# Altium project Smart_Connect_Board.PrjPcb (part 1 of 4)
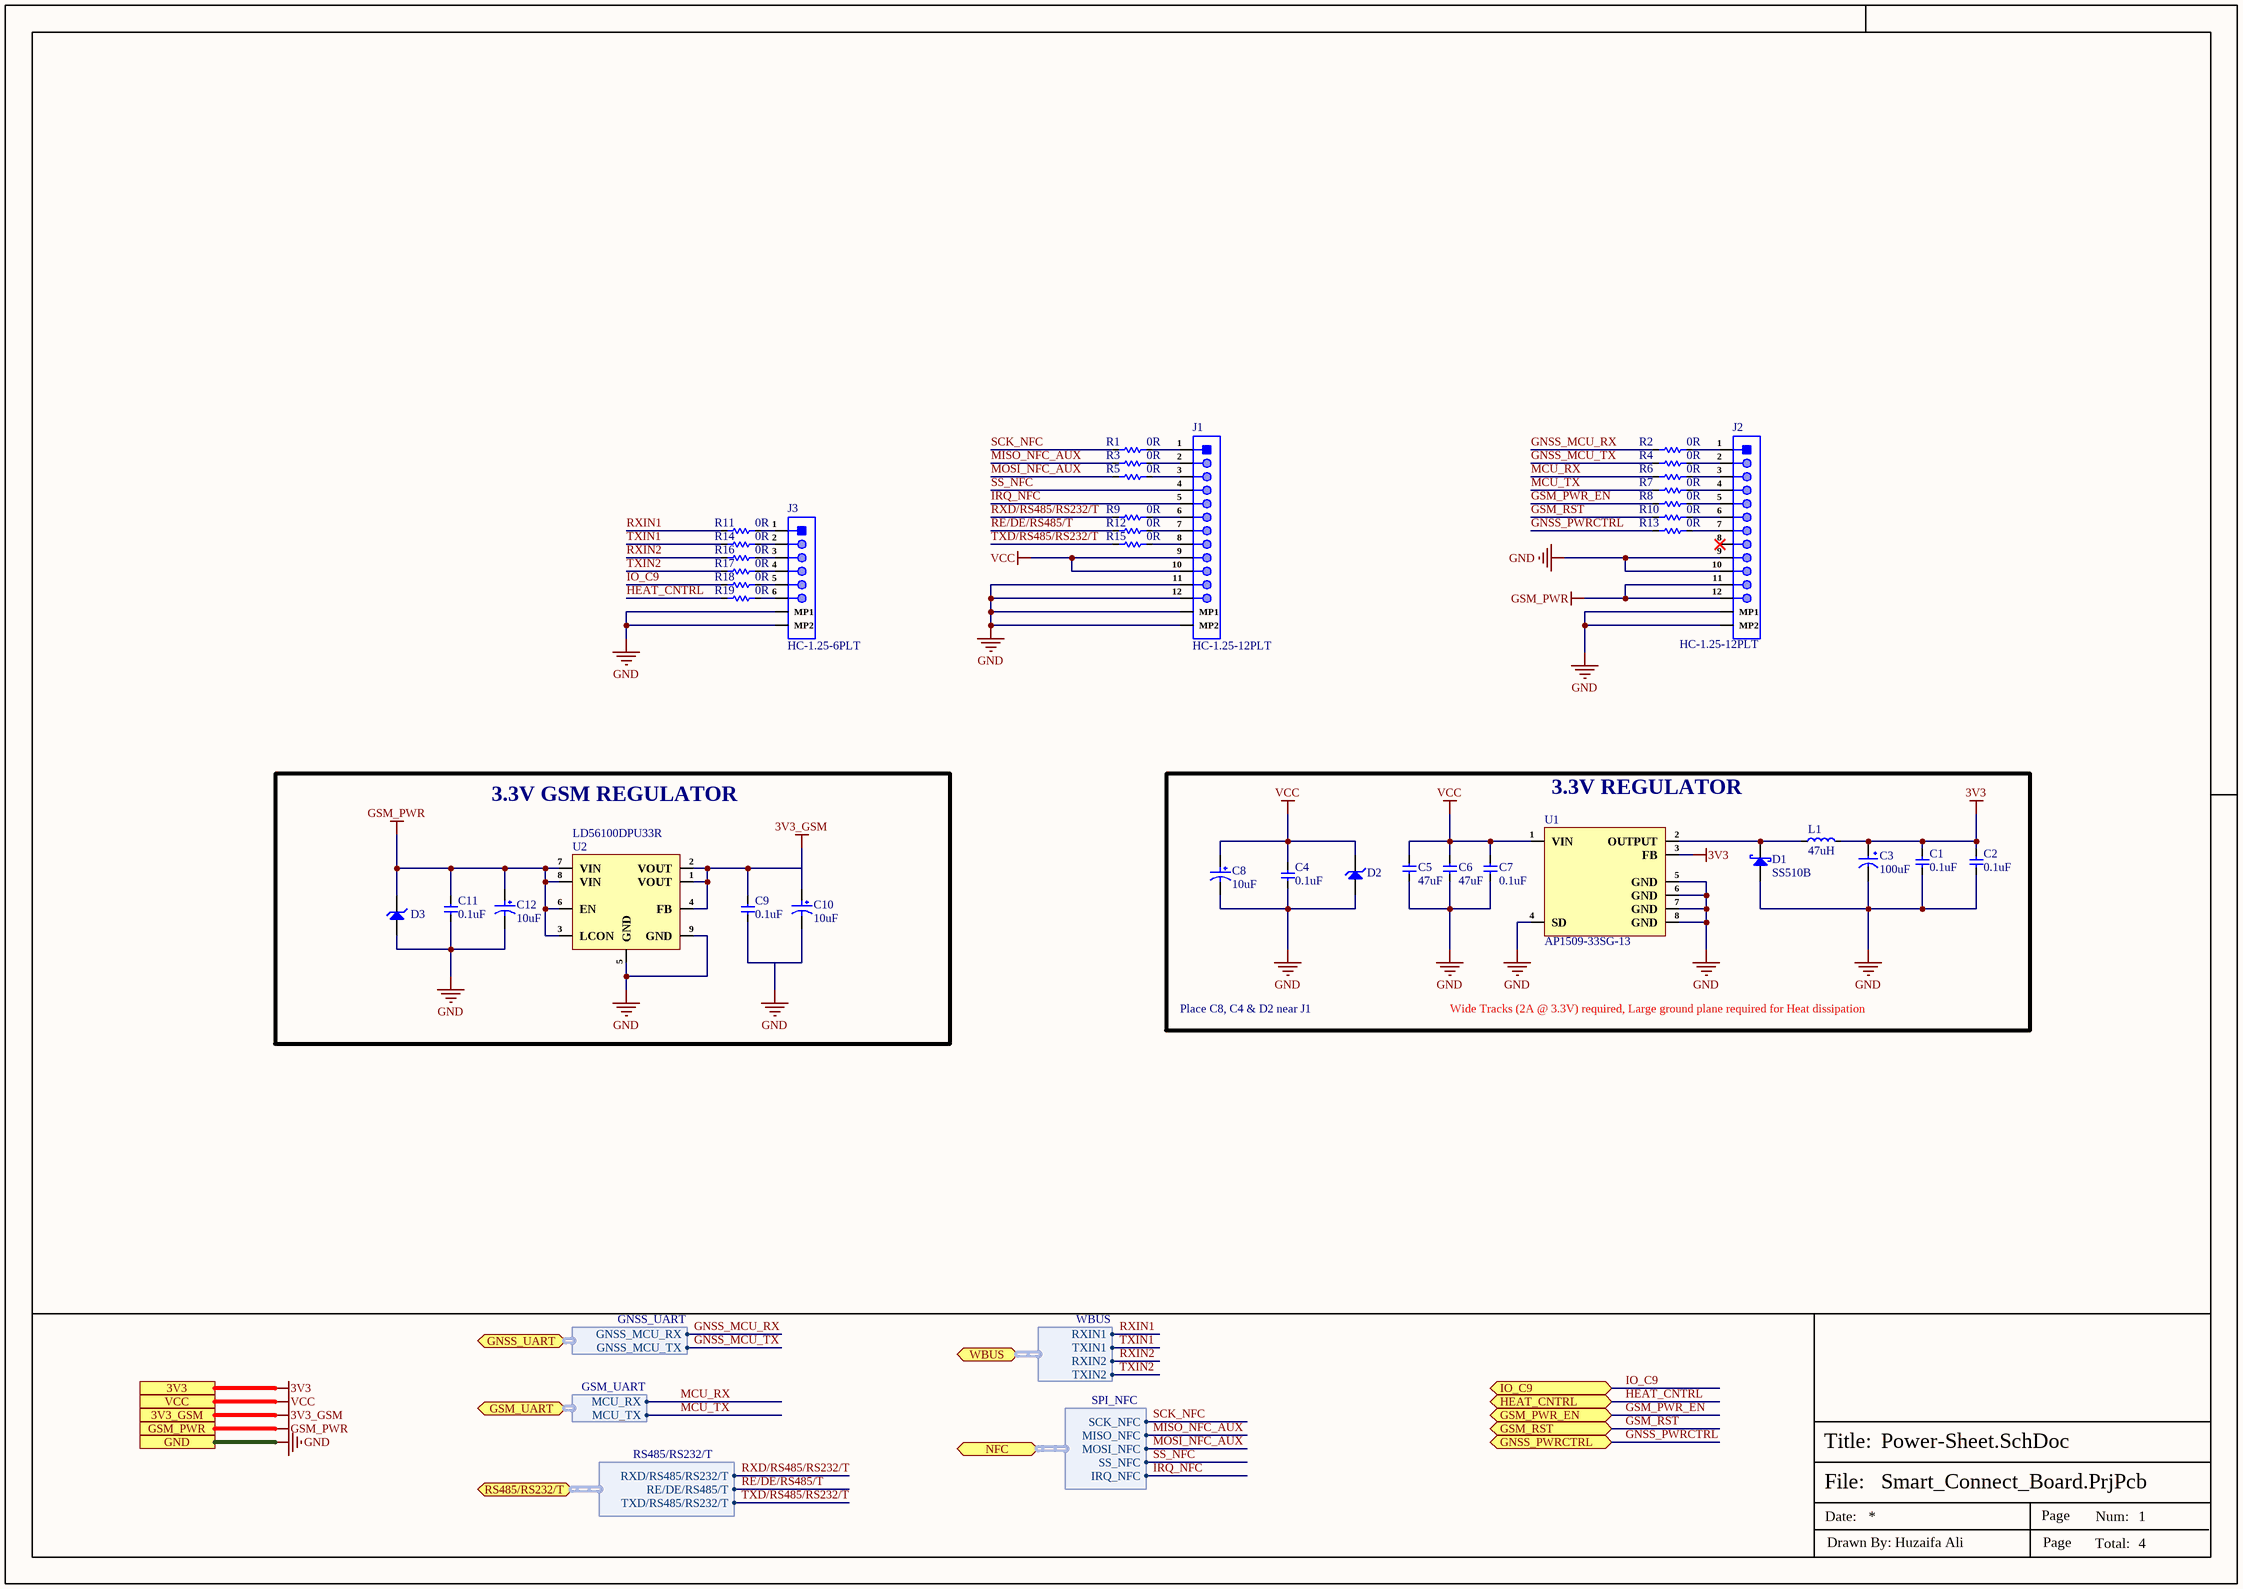
[diagram p0: Power-Sheet.SchDoc]
4 sheets, 211 parts. Net scope: flat (ports and power ports of the same name join across sheets).
Board file: Smart_Connect_Board.PcbDoc
Sheets:
  Power-Sheet.SchDoc
  GSM_Sheet.SchDoc
  Ultrasonic_NFC_Sheet.SchDoc
  Heater_Sheet.SchDoc

## Sheet Power-Sheet.SchDoc
size 420 x 297 mm; SheetNumber: 1; SheetTotal: 4

### Parts
C1  0.1uF  [Cap-0603]
C2  0.1uF  [Cap-0603]
C3  100uF  [Case-B]
C4  0.1uF  [Cap-0603]
C5  47uF  [Cap-1206]
C6  47uF  [Cap-1206]
C7  0.1uF  [Cap-0402]
C8  10uF  [RVT1E100M0405_]
C9  0.1uF  [Cap-0603]
C10  10uF  [RVT1E100M0405_]
C11  0.1uF  [Cap-0603]
C12  10uF  [RVT1E100M0405_]
D1  SS510B  [SMB_]
D2  SMBJ5355B-MS  [SMB_]  (value not drawn)
D3  1SMA5930BT3G  [SMA]  (value not drawn)
J1  HC-1.25-12PLT  [HC-1.25-12PLT]
J2  HC-1.25-12PLT  [HC-1.25-12PLT]
J3  HC-1.25-6PLT  [HC-1.25-6PLT]
L1  47uH  [MDA1040-470M]
R1  0R  [Res-0603]
R2  0R  [Res-0603]
R3  0R  [Res-0603]
R4  0R  [Res-0603]
R5  0R  [Res-0603]
R6  0R  [Res-0603]
R7  0R  [Res-0603]
R8  0R  [Res-0603]
R9  0R  [Res-0603]
R10  0R  [Res-0603]
R11  0R  [Res-0603]
R12  0R  [Res-0603]
R13  0R  [Res-0603]
R14  0R  [Res-0603]
R15  0R  [Res-0603]
R16  0R  [Res-0603]
R17  0R  [Res-0603]
R18  0R  [Res-0603]
R19  0R  [Res-0603]
U1  AP1509-33SG-13  [SOP-8L]
U2  LD56100DPU33R  [DFN-8(1.2x1.6)]

### Blocks framed on the sheet
3.3V GSM REGULATOR: C9-C12 D3 U2
3.3V REGULATOR: C1-C8 D1 D2 L1 U1

### Ports
3V3 (see Heater_Sheet[1D], Ultrasonic_NFC_Sheet[1D]), 3V3_GSM (see GSM_Sheet[4D]), GND (see GSM_Sheet[4D], Heater_Sheet[1D], Ultrasonic_NFC_Sheet[1D]), GNSS_PWRCTRL (bidir, see GSM_Sheet[5D]), GNSS_UART (bidir, harness GNSS_UART, see GSM_Sheet[4D]), GSM_PWR (see GSM_Sheet[4D]), GSM_PWR_EN (bidir, see GSM_Sheet[5D]), GSM_RST (bidir, see GSM_Sheet[5D]), GSM_UART (bidir, harness GSM_UART, see GSM_Sheet[4D]), HEAT_CNTRL (bidir, see Heater_Sheet[4D]), IO_C9 (bidir, see Heater_Sheet[4D]), NFC (bidir, harness SPI_NFC, see Ultrasonic_NFC_Sheet[2D]), RS485/RS232/T (bidir, harness RS485/RS232/T, see Ultrasonic_NFC_Sheet[2D]), VCC (see Heater_Sheet[1D], Ultrasonic_NFC_Sheet[1D]), WBUS (bidir, harness WBUS, see Heater_Sheet[2D])

### Harnesses
GSM_UART: MCU_RX, MCU_TX
GNSS_UART: GNSS_MCU_RX, GNSS_MCU_TX
RS485/RS232/T: RXD/RS485/RS232/T, RE/DE/RS485/T, TXD/RS485/RS232/T
WBUS: RXIN1, TXIN1, RXIN2, TXIN2
SPI_NFC: MISO_NFC, MOSI_NFC, SS_NFC, IRQ_NFC, SCK_NFC

### Nets
3V3: C1.2 C2.2 C3.1 L1.2 U1.3(FB) ; port 3V3
3V3_GSM: C9.2 C10.1 U2.1(VOUT) U2.2(VOUT) U2.4(FB) ; port 3V3_GSM
GND: C1.1 C2.1 C3.2 C4.1 C5.1 C6.1 C7.1 C8.2 C9.1 C10.2 C11.1 C12.2 D1.1(A) D2.1(A) D3.2(A) J1.11 J1.12 J1.MP1 J1.MP2 J2.9 J2.10 J2.MP1 J2.MP2 J3.MP1 J3.MP2 U1.4(SD) U1.5(GND) U1.6(GND) U1.7(GND) U1.8(GND) U2.5(GND) U2.9(GND) ; port GND
GSM_PWR: C11.2 C12.1 D3.1(K) J2.11 J2.12 U2.3(LCON) U2.6(EN) U2.7(VIN) U2.8(VIN) ; port GSM_PWR
VCC: C4.2 C5.2 C6.2 C7.2 C8.1 D2.2(K) J1.9 J1.10 U1.1(VIN) ; port VCC
GNSS_MCU_RX: R2.1 ; port GNSS_UART.GNSS_MCU_RX
GNSS_MCU_TX: R4.1 ; port GNSS_UART.GNSS_MCU_TX
GNSS_PWRCTRL: R13.1 ; port GNSS_PWRCTRL
GSM_PWR_EN: R8.1 ; port GSM_PWR_EN
GSM_RST: R10.1 ; port GSM_RST
HEAT_CNTRL: R19.1 ; port HEAT_CNTRL
IO_C9: R18.1 ; port IO_C9
IRQ_NFC: J1.5 ; port NFC.IRQ_NFC
MCU_RX: R6.1 ; port GSM_UART.MCU_RX
MCU_TX: R7.1 ; port GSM_UART.MCU_TX
MISO_NFC_AUX: R3.1 ; port NFC.MISO_NFC
MOSI_NFC_AUX: R5.1 ; port NFC.MOSI_NFC
RE/DE/RS485/T: R12.1 ; port RS485/RS232/T.RE/DE/RS485/T
RXD/RS485/RS232/T: R9.1 ; port RS485/RS232/T.RXD/RS485/RS232/T
RXIN1: R11.1 ; port WBUS.RXIN1
RXIN2: R16.1 ; port WBUS.RXIN2
SCK_NFC: R1.1 ; port NFC.SCK_NFC
SS_NFC: J1.4 ; port NFC.SS_NFC
TXD/RS485/RS232/T: R15.1 ; port RS485/RS232/T.TXD/RS485/RS232/T
TXIN1: R14.1 ; port WBUS.TXIN1
TXIN2: R17.1 ; port WBUS.TXIN2
NetD1_2: D1.2(K) L1.1 U1.2(OUTPUT)
NetJ1_1: J1.1 R1.2
NetJ1_2: J1.2 R3.2
NetJ1_3: J1.3 R5.2
NetJ1_6: J1.6 R9.2
NetJ1_7: J1.7 R12.2
NetJ1_8: J1.8 R15.2
NetJ2_1: J2.1 R2.2
NetJ2_2: J2.2 R4.2
NetJ2_3: J2.3 R6.2
NetJ2_4: J2.4 R7.2
NetJ2_5: J2.5 R8.2
NetJ2_6: J2.6 R10.2
NetJ2_7: J2.7 R13.2
NetJ3_1: J3.1 R11.2
NetJ3_2: J3.2 R14.2
NetJ3_3: J3.3 R16.2
NetJ3_4: J3.4 R17.2
NetJ3_5: J3.5 R18.2
NetJ3_6: J3.6 R19.2

Not connected (* = marked no-connect by the designer): J2 8*

### Notes on the sheet
- Place C8, C4 & D2 near J1
- Wide Tracks (2A @ 3.3V) required, Large ground plane required for Heat dissipation
- File:
- Title:
- Date:
- Page
- Num:
- Total:
- Drawn By: Huzaifa Ali

### Library data of the parts
C1 C2 C4 C9 C11 = CC0603ZRY5V9BB104: CAP CER 0.1UF 50V Y5V 0603; Manufacturer: Yageo; Capacitance: 100nF; Tolerance: 80%; Item Type: Capacitor; Supplier 1: Digi-Key; Manufacturer Part Number: CC0603ZRY5V9BB104; Stock 1: 15000880; Pricing 1: 1=0.1, 10=0.075, 100=0.0334, 500=0.02386, 1000=0.01874 (USD); Mount: Surface Mount; Case/Package: 0603; Number of Pins: 2; Case Code (Metric): 1608; Case Code (Imperial): 0603; Min Operating Temperature: -30°C; Max Operating Temperature: 85°C; Dielectric: Y5V; Voltage Rating: 50V; Package Quantity: 1; Packaging: Tape and Reel; Voltage Rating (DC): 50V; Termination: SMD/SMT; Composition: Ceramic; Voltage: 50V; Length: 1.6mm; Height: 0.8mm; Width: 0.031inch; Thickness: 0.035inch; Depth: 0.8mm; Radiation Hardening: No; REACH SVHC: No SVHC; Lead Free: Lead Free; Halogen Free: Halogen Free; ComponentLink1URL: http://www.yageo.com/documents/recent/UPY-GPHC_Y5V_6.3V-to-50V_8.pdf?src-supplier=Digi-Key; ComponentLink1Description: http://www.yageo.com/documents/recent/UPY-GPHC_Y5V_6.3V-to-50V_8.pdf?src-supplier=Digi-Key; ComponentLink2URL: http://www.yageo.com/documents/recent/UPY-GPHC_Y5V_6.3V-to-50V_5.pdf?src-supplier=Avnet+Europe; ComponentLink2Description: http://www.yageo.com/documents/recent/UPY-GPHC_Y5V_6.3V-to-50V_5.pdf?src-supplier=Avnet+Europe; ComponentLink3URL: https://www.verical.com/server-webapp/html/getDatasheet?partID=403611&src-supplier=Verical; ComponentLink3Description: https://www.verical.com/server-webapp/html/getDatasheet?partID=403611&src-supplier=Verical; ComponentLink4URL: http://www.mouser.com/ds/2/447/Yageo_UPY-GP_NP0_16V-to-50V_9-358835.pdf?src-supplier=Mouser; ComponentLink4Description: http://www.mouser.com/ds/2/447/Yageo_UPY-GP_NP0_16V-to-50V_9-358835.pdf?src-supplier=Mouser; ComponentLink5URL: http://www.farnell.com/datasheets/1132289.pdf?src-supplier=Element14; ComponentLink5Description: http://www.farnell.com/datasheets/1132289.pdf?src-supplier=Element14; Supplier Part Number 1: 311-1343-1-ND; LCSC Part Number: C106221
C3 = TAJB107M010RNJ: CAP TANT 100UF 20% 10V 1411; Manufacturer: Kyocera AVX; Dielectric Material: Tantalum; Tolerance: 10%; ESR (Equivalent Series Resistance): 1.4R; Leakage Current: 10uA; Dissipation Factor: 8%; Item Type: Capacitor; Supplier 1: Rs; Manufacturer Part Number: TAJB107M010RNJ; RoHS: Yes; Category: Tantalum Capacitors; Stock 1: 17520; Pricing 1: 2000=0.302 (GBP); Mounting Technology: Surface Mount; Case/Package: 1210; Case Code (Imperial): 1210; Case Code (Metric): 3528; Min Operating Temperature: -55°C; Max Operating Temperature: 125°C; Value: 100uF; Voltage Rating (DC): 10V; Series: TAJ; Construction: Flat; Voltage Rating: 10V; Package Quantity: 2000; Packaging: Tape and Reel; Termination: SMD/SMT; Voltage: 10V; Features: General Purpose; Length: 3.5mm; Width: 2.8mm; Height: 2.1mm; Depth: 2.8mm; Radiation Hardening: No; Lead Free: Lead Free; RoHS Compliant: Yes; Reach SVHC Compliant: No; ComponentLink1URL: https://datasheet.ciiva.com/264/taj-264281.pdf?src-supplier=Digi-Key; ComponentLink1Description: https://datasheet.ciiva.com/264/taj-264281.pdf?src-supplier=Digi-Key; ComponentLink2URL: https://datasheet.ciiva.com/264/taj-264280.pdf?src-supplier=Digi-Key; ComponentLink2Description: https://datasheet.ciiva.com/264/taj-264280.pdf?src-supplier=Digi-Key; ComponentLink3URL: https://datasheet.ciiva.com/264/taj-264282.pdf?src-supplier=Digi-Key; ComponentLink3Description: https://datasheet.ciiva.com/264/taj-264282.pdf?src-supplier=Digi-Key; ComponentLink4URL: https://datasheet.ciiva.com/11225/taj-11225964.pdf?src-supplier=Avnet; ComponentLink4Description: https://datasheet.ciiva.com/11225/taj-11225964.pdf?src-supplier=Avnet; ComponentLink5URL: https://datasheet.ciiva.com/11225/taj-11225963.pdf?src-supplier=Avnet; ComponentLink5Description: https://datasheet.ciiva.com/11225/taj-11225963.pdf?src-supplier=Avnet; Supplier Part Number 1: 1354069; LCSC Part Number: C7196
C5 C6 = GRM31CR61E476ME44L: CAP CER 47UF 25V X5R 1206; Manufacturer: Murata; Tolerance: 20%; Item Type: Capacitor; Supplier 1: Digi-Key; Manufacturer Part Number: GRM31CR61E476ME44L; RoHS: Yes; Category: Ceramic Capacitors; Capacitance: 47uF; Voltage Rating (DC): 25V; Dielectric: X5R; Length: 3.2mm; Width: 1.6mm; Thickness: 1.6mm; ComponentLink1URL: https://search.murata.co.jp/Ceramy/image/img/A01X/partnumbering_e_01.pdf?src-supplier=Digi-Key; ComponentLink1Description: https://search.murata.co.jp/Ceramy/image/img/A01X/partnumbering_e_01.pdf?src-supplier=Digi-Key; Supplier Part Number 1: 490-16268-2-ND; LCSC Part Number: C403725
C7 = GRM155R71E104KE14D: CAP CER 0.1UF 25V X7R 0402; Manufacturer: Murata; Item Type: Capacitors; Dielectric Material: Ceramic; Material: 4241ConductorMaterial; Value: 100nF; Tolerance: 10%; Supplier: Mouser; LCSC Part Number: C77014; Manufacturer Part Number: GRM155R71E104KE14D; RoHS: Yes; Stock: 652368; Pricing: 1=0.1, 10=0.007, 50=0.007, 100=0.005, 1000=0.005, 10000=0.004 (USD); Mounting Technology: Surface Mount; Case/Package: 0402; Pins: 2NUMBER; Case Code (Metric): 1005; Case Code (Imperial): 0402; Weight: 0.000212oz; Min Operating Temperature: -55°C; Max Operating Temperature: 125°C; Packaging: Tape and Reel; Voltage Rating: 25V; Dielectric: X7R; Voltage: 25V; Termination: SMD/SMT; Voltage Rating (DC): 25V; Package Quantity: 10000; Series: GRM; Length: 1mm; Width: 0.02inch; Height: 0.5mm; Thickness: 0.022inch; Depth: 0.5mm; RoHS Compliant: Yes; Reach SVHC Compliant: Unknown; Lead Free: 5697LeadFree; ComponentLink1URL: http://www.farnell.com/datasheets/1872206.pdf?src-supplier=Farnell; ComponentLink1Description: http://www.farnell.com/datasheets/1872206.pdf?src-supplier=Farnell; ComponentLink2URL: http://www.mouser.com/ds/2/281/c02e-2905.pdf?src-supplier=Mouser; ComponentLink2Description: http://www.mouser.com/ds/2/281/c02e-2905.pdf?src-supplier=Mouser; ComponentLink3URL: http://uk.rs-online.com/webdocs/144c/0900766b8144c113.pdf?src-supplier=Rs; ComponentLink3Description: http://uk.rs-online.com/webdocs/144c/0900766b8144c113.pdf?src-supplier=Rs; ComponentLink4URL: https://datasheet.octopart.com/GRM155R71E104KE14D-Murata-datasheet-62346597.pdf?src-supplier=Future+Electronics; ComponentLink4Description: https://datasheet.octopart.com/GRM155R71E104KE14D-Murata-datasheet-62346597.pdf?src-supplier=Future+Electronics; ComponentLink5URL: https://search.murata.co.jp/Ceramy/image/img/A01X/G101/ENG/GRM155R71E104KE14-01.pdf?src-supplier=Digikey; ComponentLink5Description: https://search.murata.co.jp/Ceramy/image/img/A01X/G101/ENG/GRM155R71E104KE14-01.pdf?src-supplier=Digikey; ComponentLink6URL: http://www.farnell.com/datasheets/2048008.pdf?src-supplier=Newark; ComponentLink6Description: http://www.farnell.com/datasheets/2048008.pdf?src-supplier=Newark; ComponentLink7URL: https://datasheet.octopart.com/GRM155R71E104KE14D-Murata-datasheet-62317124.pdf?src-supplier=Element14; ComponentLink7Description: https://datasheet.octopart.com/GRM155R71E104KE14D-Murata-datasheet-62317124.pdf?src-supplier=Element14; ComponentLink8URL: http://psearch.en.murata.com/capacitor/product/GRM155R71E104KE14%23.pdf?src-supplier=Avnet; ComponentLink8Description: http://psearch.en.murata.com/capacitor/product/GRM155R71E104KE14%23.pdf?src-supplier=Avnet
C8 C10 C12 = RVT1E100M0405: CAP ALUM 10uF 25V SMD; Manufacturer: ROQANG; φD: 4mm; L: 5.4mm; Tolerance: ±20%; Item Type: Capacitor; Operating Temperature: -45℃~+105℃; Rated Voltage: 25V; Capacitance: 10uF; Manufacturer Part Number: RVT1E100M0405; ComponentLink1Description: LCSC; ComponentLink1URL: https://www.lcsc.com/product-detail/Aluminum-Electrolytic-Capacitors-SMD_10uF-25V-20_C72484.html; LCSC Part Number: C970655
D1 = SS510B: SCHOTTKY DIODE SMB 100V 5A; Manufacturer: MDD; Manufacturer Part Number: SS510B; Package: SMB; ComponentLink1Description: LCSC; ComponentLink1URL: https://www.lcsc.com/product-detail/Schottky-Barrier-Diodes-SBD_JUXING-SS510B_C3011128.html; LCSC Part Number: C3011128; Item Type: Diode
D2 = SMBJ5355B-MS: Independent 5W 18V SMB Zener Diodes ROHS; Manufacturer: MSKSEMI; Item Type: Diode; Manufacturer Part Number: SMBJ5355B-MS; Package: SMB; LCSC Part Number: C18547762; ComponentLink1Description: LCSC; ComponentLink1URL: https://lcsc.com/product-detail/Zener-Diodes_MSKSEMI-SMBJ5355B-MS_C18547762.html
D3 = 1SMA5930BT3G: DIODE ZENER 16V 1.5W SMA; Manufacturer: onsemi; Item Type: Zener diode; Manufacturer Part Number: 1SMA5930BT3G; Package: SMA; LCSC Part Number: C128848; ComponentLink1Description: LCSC; ComponentLink1URL: https://www.lcsc.com/product-detail/Zener-Diodes_onsemi-1SMA5930BT3G_C128848.html
J1 J2 = HC-1.25-12PLT: 1x12P 12P PicoBlade(MX 1.25) Tin 12 -25℃~+85℃ 2A 1 1.25mm Brass Surface Mount,Vertical SMD,P=1.25mm Wire To Board Connector ROHS; Manufacturer: HCTL; Manufacturer Part Number: HC-1.25-12PLT; Package: SMD,P=1.25mm; LCSC Part Number: C2937190; Item Type: Wire To Board Connector; ComponentLink1Description: LCSC; ComponentLink1URL: https://lcsc.com/product-detail/Wire-To-Board-Connector_HCTL-HC-1-25-12PLT_C2937190.html?s_z=n_1.25-12plt
J3 = HC-1.25-6PLT: 1x6P 6P PicoBlade(MX 1.25) Tin 6 -25℃~+85℃ 2A 1 1.25mm Brass Surface Mount,Vertical SMD,P=1.25mm Wire To Board Connector ROHS; Manufacturer: HCTL; Manufacturer Part Number: HC-1.25-6PLT; Package: SMD,P=1.25mm; LCSC Part Number: C2845392; Item Type: Connector; ComponentLink1Description: LCSC; ComponentLink1URL: https://lcsc.com/product-detail/Wire-To-Board-Connector_HCTL-HC-1-25-6PLT_C2845392.html?s_z=n_HC-1.25-6PLT
L1 = MDA1040-470M: 3.5A 47uH ±20% 4A 125mΩ SMD,10x11mm Inductors (SMD) ROHS; Manufacturer: KOHERelec; Manufacturer Part Number: MDA1040-470M; LCSC Part Number: C2847557; Package: SMD,10x11mm; ComponentLink1Description: LCSC; ComponentLink1URL: https://www.lcsc.com/product-detail/Inductors-SMD_KOHERelec-MDA1040-470M_C2847557.html; Item Type: Inductor
R1-R19 = RC0603JR-070RL: RES 0 OHM JUMPER 1/10W 0603; Manufacturer: Yageo; Resistance: 0mR; Tolerance: 1%; Power Rating: 100mW; Voltage Rating (DC): 50V; Temperature Coefficient: 200ppm/°C; Resistance Tolerance: 5%; Item Type: Resistor; Supplier 1: Digi-Key; Manufacturer Part Number: RC0603JR-070RL; RoHS: Yes; Category: Chip SMD Resistors; Stock 1: 18081776; Pricing 1: 1=0.10000, 10=0.01700, 25=0.01240, 50=0.00960, 100=0.00700, 250=0.00536, 500=0.00430, 1000=0.00316 (USD); Case/Package: 0603; Number of Pins: 2; Contact Plating: Tin,Matte; Case Code (Imperial): 0603; Case Code (Metric): 1608; Size Code: 0603; Min Operating Temperature: -55°C; Max Operating Temperature: 155°C; Resistor Type: Thick Film; Packaging: Tape and Reel; Termination: SMD/SMT; Series: RC; Technology: THICK FILM; Package Quantity: 5000; Voltage Rating: 50V; Features: Moisture Resistant; Max Power Dissipation: 100mW; Number of Terminations: 2; Construction: Rectangular; Length: 1.6mm; Width: 0.8mm; Height: 0.45mm; Depth: 0.8mm; Radiation Hardening: No; Reach SVHC Compliant: No SVHC; Lead Free: Lead Free; RoHS Compliant: Yes; Military Standard: Not; Supplier Part Number 1: 311-0.0GRCT-ND; LCSC Part Number: C95177
U1 = AP1509-33SG-13: IC REG BUCK 3.3V 2A 8SOP; Manufacturer: Diodes; Supplier: Digi-Key; Supplier Part Number: AP1509-33SGDICT-ND; Manufacturer Part Number: AP1509-33SG-13; RoHS: Yes; Category: Voltage Regulators - Switching; Stock: 7160; Pricing: 1=1.6, 10=1.43, 25=1.3576, 100=1.115, 250=1.04232, 500=0.92112, 1000=0.7272 (USD); ComponentLink1URL: https://datasheet.ciiva.com/2024/ap1509-2024112.pdf?src-supplier=Digi-Key; ComponentLink1Description: https://datasheet.ciiva.com/2024/ap1509-2024112.pdf?src-supplier=Digi-Key; ComponentLink2URL: https://datasheet.ciiva.com/22696/608784-22696879.pdf?src-supplier=Element14; ComponentLink2Description: https://datasheet.ciiva.com/22696/608784-22696879.pdf?src-supplier=Element14; ComponentLink3URL: https://datasheet.ciiva.com/3220/ap1509-3220415.pdf?src-supplier=Avnet; ComponentLink3Description: https://datasheet.ciiva.com/3220/ap1509-3220415.pdf?src-supplier=Avnet; ComponentLink4URL: https://datasheet.ciiva.com/3222/ap1509-3222047.pdf?src-supplier=Avnet; ComponentLink4Description: https://datasheet.ciiva.com/3222/ap1509-3222047.pdf?src-supplier=Avnet; ComponentLink5URL: https://datasheet.ciiva.com/1161/608784-1161659.pdf?src-supplier=Element14; ComponentLink5Description: https://datasheet.ciiva.com/1161/608784-1161659.pdf?src-supplier=Element14; LCSC Part Number: C151823; Item Type: IC
U2 = LD56100DPU33R: IC REG LINEAR 3.3V 1A 8DFN; Manufacturer: STMicroelectronics; Output Type: Fixed; Output Configuration: Positive; Number of Regulators: 1; Max Supply Voltage: 5.5V; Quiescent Current: 155uA; Power Supply Rejection Ratio (PSRR): 55dB; Supplier: Mouser; LCSC Part Number: C2969937; Manufacturer Part Number: LD56100DPU33R; RoHS: Yes; Item Type: IC; Pricing: 1=1.23, 10=0.751, 50=0.751, 100=0.479, 1000=0.326, 10000=0.229 (USD); Mounting Technology: Surface Mount; Case/Package: DFN; Min Operating Temperature: -40°C; Max Operating Temperature: 85°C; Packaging: Cut Tape; Min Output Voltage: 3.3V; Output Current: 1A; Series: -; RoHS Compliant: Yes; ComponentLink1URL: https://www.st.com/resource/en/datasheet/ld56100.pdf?src-supplier=Digikey; ComponentLink1Description: https://www.st.com/resource/en/datasheet/ld56100.pdf?src-supplier=Digikey

## Sheet GSM_Sheet.SchDoc
size 420 x 297 mm; SheetNumber: 2; SheetTotal: 4
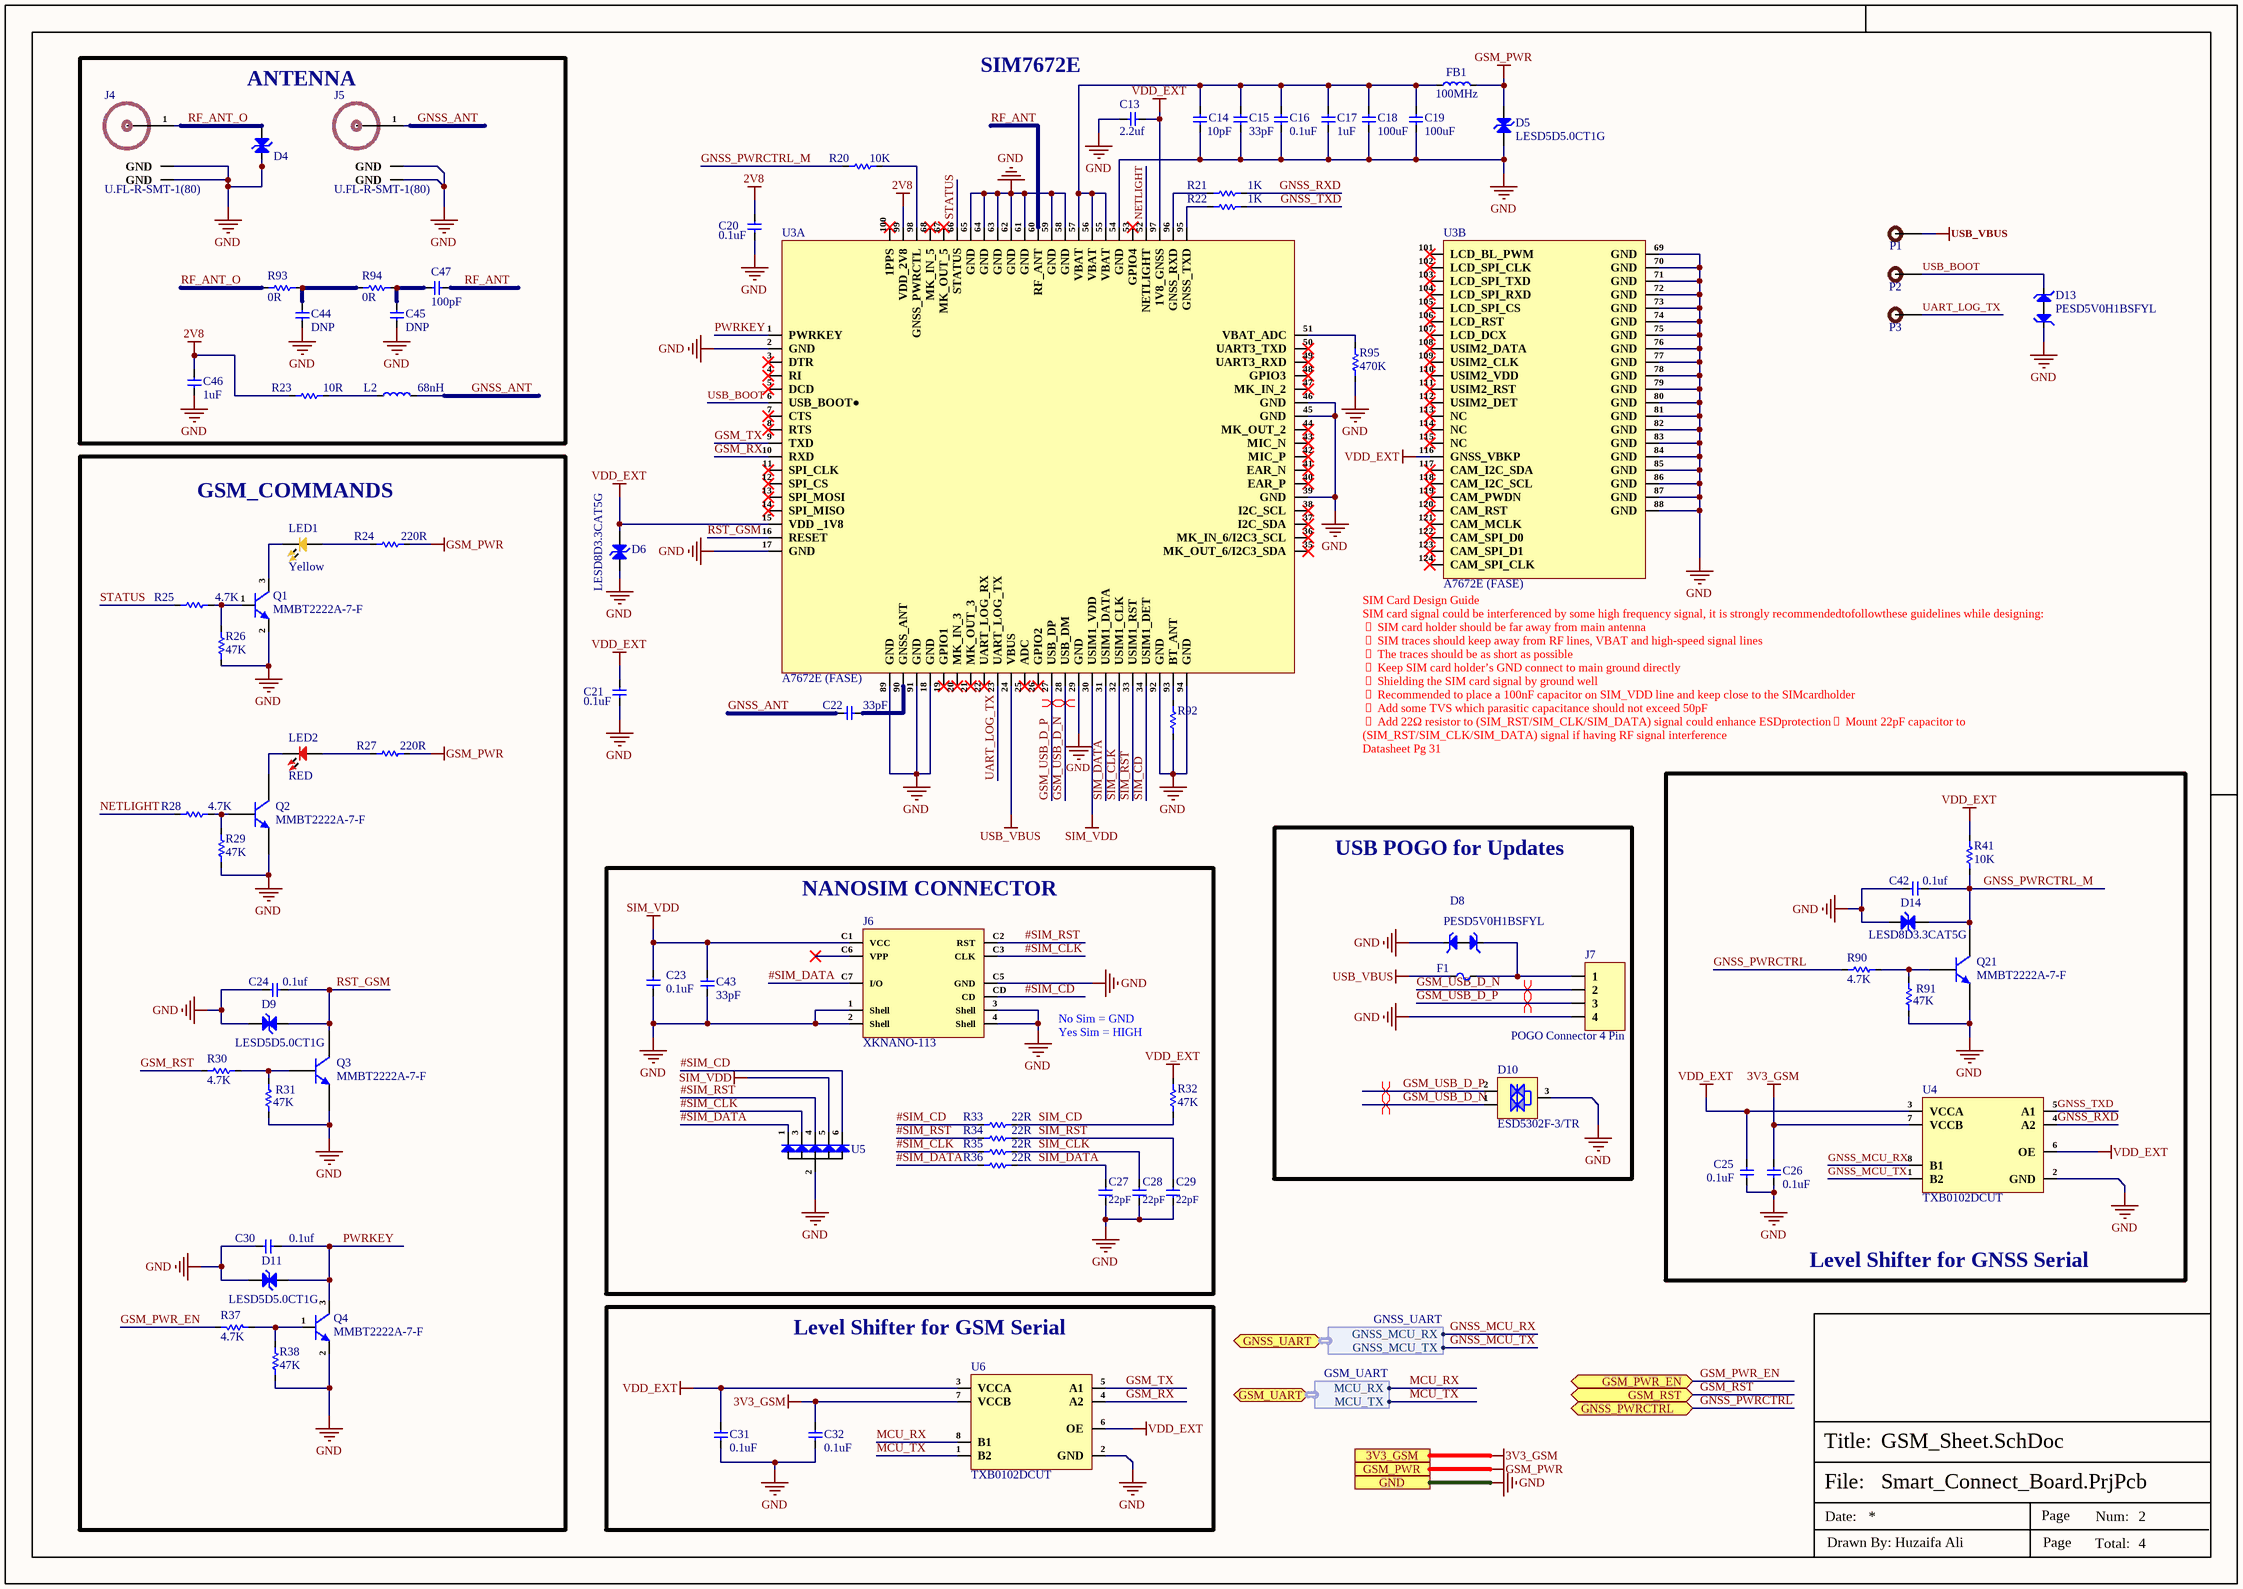
[diagram p1: GSM_Sheet.SchDoc]

### Parts
C13  2.2uf  [Cap-0402]
C14  10pF  [Cap-0402]
C15  33pF  [Cap-0402]
C16  0.1uF  [Cap-0402]
C17  1uF  [Cap-0402]
C18  100uF  [Cap-1206]
C19  100uF  [Cap-1206]
C20  0.1uF  [CAP-0201]
C21  0.1uF  [CAP-0201]
C22  33pF  [Cap-0402]
C23  0.1uF  [CAP-0201]
C24  0.1uf  [Cap-0402]
C25  0.1uF  [CAP-0201]
C26  0.1uF  [CAP-0201]
C27  22pF  [CAP-0201]
C28  22pF  [CAP-0201]
C29  22pF  [CAP-0201]
C30  0.1uf  [Cap-0402]
C31  0.1uF  [CAP-0201]
C32  0.1uF  [CAP-0201]
C42  0.1uf  [Cap-0402]
C43  33pF  [Cap-0402]
C44  DNP  [Cap-0402]
C45  DNP  [Cap-0402]
C46  1uF  [Cap-0402]
C47  100pF  [Cap-0402]
D4  TPESD0402G03V  [TPESD0402G03V]  (value not drawn)
D5  LESD5D5.0CT1G  [SOD-523]
D6  LESD8D3.3CAT5G  [SOD-882 Bi Directional]
D8  PESD5V0H1BSFYL  [DSN0603-2]
D9  LESD5D5.0CT1G  [SOD-523 (Bi-Directional)]
D10  ESD5302F-3/TR  [Sot-23]
D11  LESD5D5.0CT1G  [SOD-523 (Bi-Directional)]
D13  PESD5V0H1BSFYL  [DSN0603-2]
D14  LESD8D3.3CAT5G  [SOD-882 Bi Directional]
F1  SMD0603-050  [Fuse-0603]  (value not drawn)
FB1  100MHz  [Ind-0805]
J4  U.FL-R-SMT-1(80)  [U.FL-R-SMT-1(80)_]
J5  U.FL-R-SMT-1(80)  [U.FL-R-SMT-1(80)_]
J6  XKNANO-113  [XKNANO-113]
J7  POGO Connector 4 Pin  [Pogo 4 Pin]
L2  68nH  [IND-0603 (1608 Metric)]
LED1  Yellow  [LED-0603]
LED2  RED  [LED-0603]
P1  TEST POINT  [Test-point]  (value not drawn)
P2  TEST POINT  [Test-point]  (value not drawn)
P3  TEST POINT  [Test-point]  (value not drawn)
Q1  MMBT2222A-7-F  [SOT-23]
Q2  MMBT2222A-7-F  [SOT-23]
Q3  MMBT2222A-7-F  [SOT-23]
Q4  MMBT2222A-7-F  [SOT-23]
Q21  MMBT2222A-7-F  [SOT-23]
R20  10K  [Res-0402]
R21  1K  [Res-0201]
R22  1K  [Res-0201]
R23  10R  [Res-0402]
R24  220R  [Res-0603]
R25  4.7K  [Res-0402]
R26  47K  [Res-0402]
R27  220R  [Res-0603]
R28  4.7K  [Res-0402]
R29  47K  [Res-0402]
R30  4.7K  [Res-0402]
R31  47K  [Res-0402]
R32  47K  [Res-0402]
R33  22R  [Res-0201]
R34  22R  [Res-0201]
R35  22R  [Res-0201]
R36  22R  [Res-0201]
R37  4.7K  [Res-0402]
R38  47K  [Res-0402]
R41  10K  [Res-0402]
R90  4.7K  [Res-0402]
R91  47K  [Res-0402]
R92  51R  [Res-1206]  (value not drawn)
R93  0R  [Res-0402]
R94  0R  [Res-0402]
R95  470K  [Res-0402]
U3  A7672E (FASE)  [A7672E (FASE)]  (parts A,B of 2)
U4  TXB0102DCUT  [TXB0102DCUT]
U5  SMF05CT1G-ES  [SOT-363]  (value not drawn)
U6  TXB0102DCUT  [TXB0102DCUT]

### Blocks framed on the sheet
ANTENNA: C44-C47 D4 J4 J5 L2 R23 R93 R94
GSM_COMMANDS: C24 C30 D9 D11 LED1 LED2 Q1-Q4 R24-R31 R37 R38
Level Shifter for GNSS Serial: C25 C26 C42 D14 Q21 R41 R90 R91 U4
USB POGO for Updates: D8 D10 F1 J7
NANOSIM CONNECTOR: C23 C27-C29 C43 J6 R32-R36 U5
Level Shifter for GSM Serial: C31 C32 U6

### Ports
3V3_GSM (see Power-Sheet[1D]), GND (see Heater_Sheet[1D], Power-Sheet[1D], Ultrasonic_NFC_Sheet[1D]), GNSS_PWRCTRL (bidir, see Power-Sheet[4D]), GNSS_UART (bidir, harness GNSS_UART, see Power-Sheet[2D]), GSM_PWR (see Power-Sheet[1D]), GSM_PWR_EN (bidir, see Power-Sheet[4D]), GSM_RST (bidir, see Power-Sheet[4D]), GSM_UART (bidir, harness GSM_UART, see Power-Sheet[2D])

### Harnesses
GSM_UART: MCU_RX, MCU_TX
GNSS_UART: GNSS_MCU_RX, GNSS_MCU_TX

### Nets
2V8: C20.1 C46.2 R23.1 U3.99(VDD_2V8)
3V3_GSM: C26.2 C32.1 U4.7(VCCB) U6.7(VCCB) ; port 3V3_GSM
GND: C13.2 C14.1 C15.1 C16.1 C17.1 C18.1 C19.1 C20.2 C21.2 C23.2 C24.1 C25.1 C26.1 C27.1 C28.1 C29.1 C30.1 C31.2 C32.2 C42.1 C43.1 C44.1 C45.1 C46.1 D4.1(A) D5.1(A) D6.2(A) D8.1 D9.1(A) D10.3(GND) D11.1(A) D13.1 D14.2(A) J4.2(GND) J4.3(GND) J5.2(GND) J5.3(GND) J6.1(Shell) J6.2(Shell) J6.3(Shell) J6.4(Shell) J6.C5(GND) J7.4 Q1.2(E) Q2.2(E) Q3.2(E) Q4.2(E) Q21.2(E) R26.1 R29.1 R31.1 R38.1 R91.1 R92.1 R95.1 U3.2(GND) U3.17(GND) U3.18(GND) U3.29(GND) U3.39(GND) U3.45(GND) U3.46(GND) U3.54(GND) U3.58(GND) U3.59(GND) U3.61(GND) U3.62(GND) U3.63(GND) U3.64(GND) U3.65(GND) U3.69(GND) U3.70(GND) U3.71(GND) U3.72(GND) U3.73(GND) U3.74(GND) U3.75(GND) U3.76(GND) U3.77(GND) U3.78(GND) U3.79(GND) U3.80(GND) U3.81(GND) U3.82(GND) U3.83(GND) U3.84(GND) U3.85(GND) U3.86(GND) U3.87(GND) U3.88(GND) U3.89(GND) U3.91(GND) U3.92(GND) U3.94(GND) U4.2(GND) U5.2(A) U6.2(GND) ; port GND
GSM_PWR: D5.2(A) FB1.2 R24.2 R27.2 ; port GSM_PWR
SIM_VDD: C23.1 C43.2 J6.C1(VCC) U3.30(USIM1_VDD) U5.5(IO4)
USB_VBUS: F1.1 P1.1 U3.24(VBUS)
VDD_EXT: C13.1 C21.1 C25.2 C31.1 D6.1(A) R32.1 R41.2 U3.15(VDD__1V8) U3.97(1V8_GNSS) U3.116(GNSS_VBKP) U4.3(VCCA) U4.6(OE) U6.3(VCCA) U6.6(OE)
#SIM_CD: J6.CD R33.1 U5.6(IO5)
#SIM_CLK: J6.C3(CLK) R35.1 U5.3(IO2)
#SIM_DATA: J6.C7(I/O) R36.1 U5.1(IO1)
#SIM_RST: J6.C2(RST) R34.1 U5.4(IO3)
GNSS_ANT: C22.2 J5.1(RF_IN) L2.2
GNSS_MCU_RX: U4.8(B1) ; port GNSS_UART.GNSS_MCU_RX
GNSS_MCU_TX: U4.1(B2) ; port GNSS_UART.GNSS_MCU_TX
GNSS_PWRCTRL: R90.1 ; port GNSS_PWRCTRL
GNSS_PWRCTRL_M: C42.2 D14.1(A) Q21.3(C) R20.2 R41.1
GNSS_RXD: R21.2 U4.4(A2)
GNSS_TXD: R22.2 U4.5(A1)
GSM_PWR_EN: R37.2 ; port GSM_PWR_EN
GSM_RST: R30.1 ; port GSM_RST
GSM_RX: U3.10(RXD) U6.4(A2)
GSM_TX: U3.9(TXD) U6.5(A1)
GSM_USB_D_N: D10.1(I/O1) J7.2 U3.28(USB_DM)
GSM_USB_D_P: D10.2(I/O2) J7.3 U3.27(USB_DP)
MCU_RX: U6.8(B1) ; port GSM_UART.MCU_RX
MCU_TX: U6.1(B2) ; port GSM_UART.MCU_TX
NETLIGHT: R28.1 U3.52(NETLIGHT)
PWRKEY: C30.2 D11.2(A) Q4.3(C) U3.1(PWRKEY)
RF_ANT: C47.2 U3.60(RF_ANT)
RF_ANT_O: D4.2(A) J4.1(RF_IN) R93.1
RST_GSM: C24.2 D9.2(A) Q3.3(C) U3.16(RESET)
SIM_CD: R32.2 R33.2 U3.34(USIM1_DET)
SIM_CLK: C28.2 R35.2 U3.32(USIM1_CLK)
SIM_DATA: C27.2 R36.2 U3.31(USIM1_DATA)
SIM_RST: C29.2 R34.2 U3.33(USIM1_RST)
STATUS: R25.1 U3.66(STATUS)
UART_LOG_TX: P3.1 U3.23(UART_LOG_TX)
USB_BOOT: D13.2 P2.1 U3.6(USB_BOOT●)
NetC14_2: C14.2 C15.2 C16.2 C17.2 C18.2 C19.2 FB1.1 U3.55(VBAT) U3.56(VBAT) U3.57(VBAT)
NetC22_1: C22.1 U3.90(GNSS_ANT)
NetC44_2: C44.2 R93.2 R94.1
NetC45_2: C45.2 C47.1 R94.2
NetD8_2: D8.2 F1.2 J7.1
NetL2_1: L2.1 R23.2
NetLED1_1: LED1.1 R24.1
NetLED1_2: LED1.2 Q1.3(C)
NetLED2_1: LED2.1 R27.1
NetLED2_2: LED2.2 Q2.3(C)
NetQ1_1: Q1.1(B) R25.2 R26.2
NetQ2_1: Q2.1(B) R28.2 R29.2
NetQ3_1: Q3.1(B) R30.2 R31.2
NetQ4_1: Q4.1(B) R37.1 R38.2
NetQ21_1: Q21.1(B) R90.2 R91.2
NetR20_1: R20.1 U3.98(GNSS_PWRCTL)
NetR21_1: R21.1 U3.96(GNSS_RXD)
NetR22_1: R22.1 U3.95(GNSS_TXD)
NetR92_2: R92.2 U3.93(BT_ANT)
NetR95_2: R95.2 U3.51(VBAT_ADC)

Not connected (* = marked no-connect by the designer): J6 C6(VPP)*; U3 3(DTR)* 4(RI)* 5(DCD)* 7(CTS)* 8(RTS)* 11(SPI_CLK)* 12(SPI_CS)* 13(SPI_MOSI)* 14(SPI_MISO)* 19(GPIO1)* 20(MK_IN_3)* 21(MK_OUT_3)* 22(UART_LOG_RX)* 25(ADC)* 26(GPIO2)* 35(MK_OUT_6/I2C3_SDA)* 36(MK_IN_6/I2C3_SCL)* 37(I2C_SDA)* 38(I2C_SCL)* 40(EAR_P)* 41(EAR_N)* 42(MIC_P)* 43(MIC_N)* 44(MK_OUT_2)* 47(MK_IN_2)* 48(GPIO3)* 49(UART3_RXD)* 50(UART3_TXD)* 53(GPIO4)* 67(MK_OUT_5)* 68(MK_IN_5)* 100(1PPS)* 101(LCD_BL_PWM)* 102(LCD_SPI_CLK)* 103(LCD_SPI_TXD)* 104(LCD_SPI_RXD)* 105(LCD_SPI_CS)* 106(LCD_RST)* 107(LCD_DCX)* 108(USIM2_DATA)* 109(USIM2_CLK)* 110(USIM2_VDD)* 111(USIM2_RST)* 112(USIM2_DET)* 113(NC)* 114(NC)* 115(NC)* 117(CAM_I2C_SDA)* 118(CAM_I2C_SCL)* 119(CAM_PWDN)* 120(CAM_RST)* 121(CAM_MCLK)* 122(CAM_SPI_D0)* 123(CAM_SPI_D1)* 124(CAM_SPI_CLK)*

### Layout directives
differential pair; net class GSM_USB; differential pair class GSM_USB_Lines; rule Impedance Constraint [Min = 88.00    Max = 90.00    ]; rule Matched Net Lengths [Tolerance = 20mil]: GSM_USB_D_N, GSM_USB_D_P
differential pair: GSM_USB_D_N, GSM_USB_D_P

### Notes on the sheet
- SIM7672E
- (near U3) SIM Card Design Guide
  SIM card signal could be interferenced by some high frequency signal, it is strongly recommendedtofollowthese guidelines while designing:
   SIM card holder should be far away from main antenna
   SIM traces should keep away from RF lines, VBAT and high-speed signal lines
   The traces should be as short as possible
   Keep SIM card holder’s GND connect to main ground directly
   Shielding the SIM card signal by ground well
   Recommended to place a 100nF capacitor on SIM_VDD line and keep close to the SIMcardholder
   Add some TVS which parasitic capacitance should not exceed 50pF
   Add 22Ω resistor to (SIM_RST/SIM_CLK/SIM_DATA) signal could enhance ESDprotection Mount 22pF capacitor to (SIM_RST/SIM_CLK/SIM_DATA) signal if having RF signal interference
  Datasheet Pg 31
- No Sim = GND
  Yes Sim = HIGH
- File:
- Title:
- Date:
- Page
- Num:
- Total:
- Drawn By: Huzaifa Ali